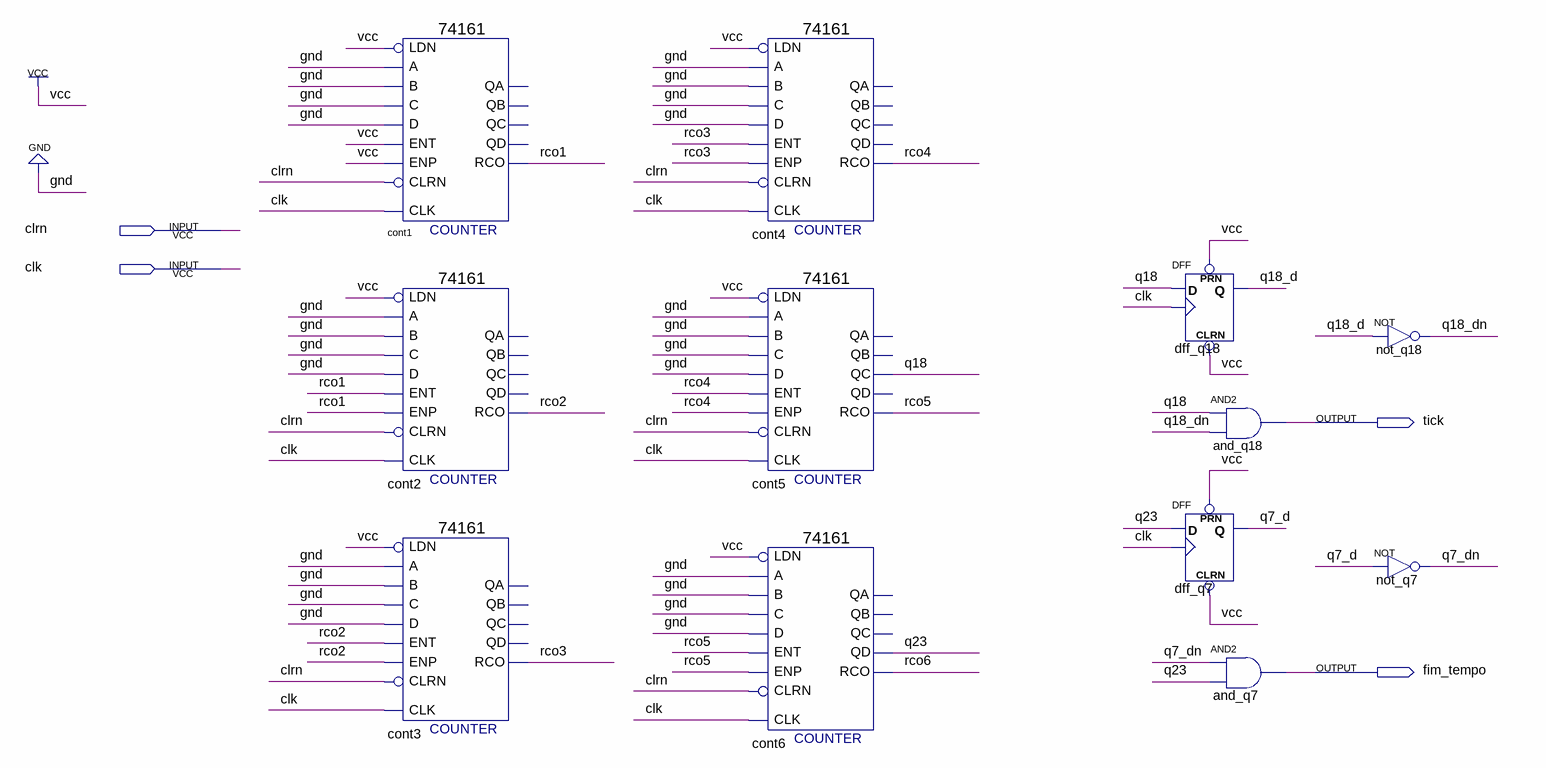
[diagram p0: schematic sheet]
// Quartus schematic divisor.bdf as structural Verilog: 12 symbols, 4 pins
module divisor (
  input  clrn,
  input  clk,
  output tick,
  output fim_tempo
);

  wire q7_d, q7_dn, q18, q18_d, q18_dn, q23, rco1, rco2, rco3, rco4, rco5, rco6;

  \74161  cont1 (
    .CLRN(clrn), .CLK(clk), .ENP(1'b1), .LDN(1'b1), .A(1'b0), .D(1'b0), .ENT(1'b1), .B(1'b0), .C(1'b0),
    .RCO(rco1));  // open: QD, QC, QB, QA
  \74161  cont2 (
    .CLRN(clrn), .CLK(clk), .ENP(rco1), .LDN(1'b1), .A(1'b0), .D(1'b0), .ENT(rco1), .B(1'b0), .C(1'b0),
    .RCO(rco2));  // open: QD, QC, QB, QA
  \74161  cont3 (
    .CLRN(clrn), .CLK(clk), .ENP(rco2), .LDN(1'b1), .A(1'b0), .D(1'b0), .ENT(rco2), .B(1'b0), .C(1'b0),
    .RCO(rco3));  // open: QD, QC, QB, QA
  \74161  cont4 (
    .CLRN(clrn), .CLK(clk), .ENP(rco3), .LDN(1'b1), .A(1'b0), .D(1'b0), .ENT(rco3), .B(1'b0), .C(1'b0),
    .RCO(rco4));  // open: QD, QC, QB, QA
  \74161  cont5 (
    .CLRN(clrn), .CLK(clk), .ENP(rco4), .LDN(1'b1), .A(1'b0), .D(1'b0), .ENT(rco4), .B(1'b0), .C(1'b0),
    .QC(q18), .RCO(rco5));  // open: QD, QB, QA
  \74161  cont6 (
    .CLRN(clrn), .CLK(clk), .ENP(rco5), .LDN(1'b1), .A(1'b0), .D(1'b0), .ENT(rco5), .B(1'b0), .C(1'b0),
    .QD(q23), .RCO(rco6));  // open: QC, QB, QA
  DFF dff_q18 (.CLRN(1'b1), .CLK(clk), .D(q18), .PRN(1'b1), .Q(q18_d));
  DFF dff_q7 (.CLRN(1'b1), .CLK(clk), .D(q23), .PRN(1'b1), .Q(q7_d));
  and and_q18 (tick, q18, q18_dn);
  and and_q7 (fim_tempo, q7_dn, q23);
  not not_q18 (q18_dn, q18_d);
  not not_q7 (q7_dn, q7_d);
endmodule
